# Altium schematic sheet 06_RS485.SchDoc: Схема электрическая принципиальная
size 420 x 297 mm; ApprovedBy: Скрябин; CheckedBy: Скрябин; Author: Корсунов; CompanyName: РТУ МИРЭА; SheetNumber: 6; SheetTotal: 11; PageSetup: Record=PageOptions|CenterHorizontal=True|CenterVertical=True|PrintScale=0.94|XCorrection=1.00|YCorrection=1.00|PrintKind=1|BorderSize=5000000|LeftOffset=0|BottomOffset=0|Orientation=1|PaperLength=1000|PaperWidth=1000|Scale=100|PaperSource=7|PrintQuality=-4|MediaType=1|DitherType=10|PaperKind=A4|PrintScaleMode=1; DecimalNumber: RP23.000001.006 Э3; Name1: Модуль ввода-вывода; lit_A: О; Name2: RP2350 OPC UA
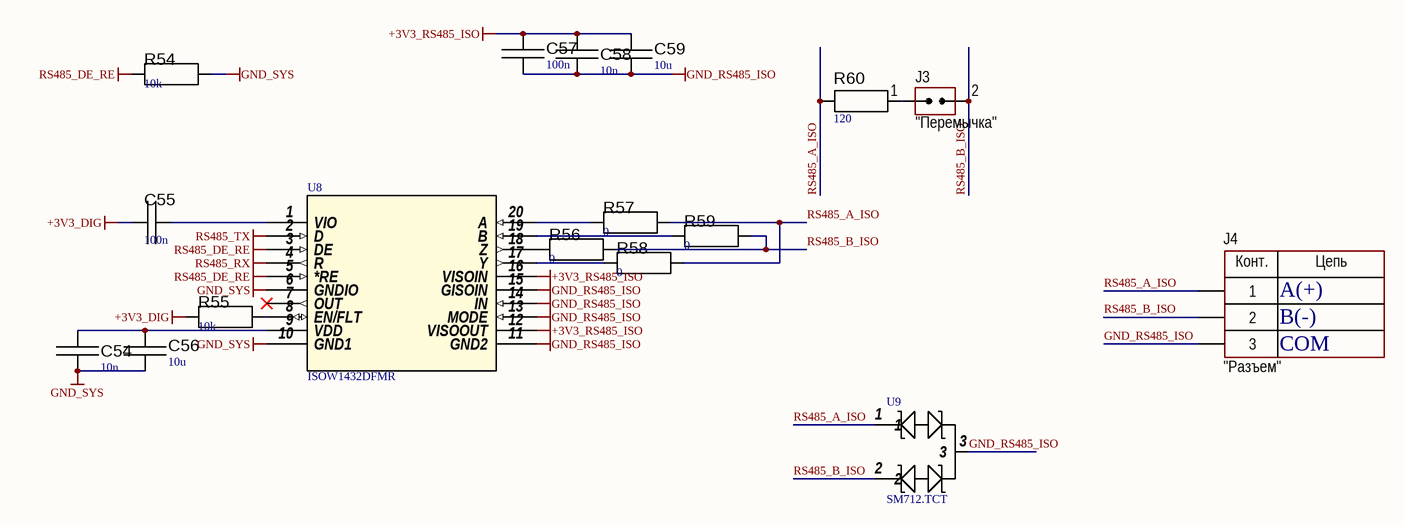
[diagram p0: 06_RS485.SchDoc]

## Parts
C54  value 10n  [C_0603]  (hidden comment: Capacitor)
C55  value 100n  [C_0603]  (hidden comment: Capacitor)
C56  value 10u  [C_0805]  (hidden comment: Capacitor)
C57  value 100n  [C_0603]  (hidden comment: Capacitor)
C58  value 10n  [C_0603]  (hidden comment: Capacitor)
C59  value 10u  [C_0805]  (hidden comment: Capacitor)
J3  CommentText: "Перемычка"  [CON: JUMPER x1]
J4  CommentText: "Разъем"  [CON: DG350-3.5-03P]
R54  value 10k  [R_0603]  (hidden comment: Resistor)
R55  value 10k  [R_0603]  (hidden comment: Resistor)
R56  value 0  [R_0603]  (hidden comment: Resistor)
R57  value 0  [R_0603]  (hidden comment: Resistor)
R58  value 0  [R_0603]  (hidden comment: Resistor)
R59  value 0  [R_0603]  (hidden comment: Resistor)
R60  value 120  [R_0603]  (hidden comment: Resistor)
U8  ISOW1432DFMR  [SOIC_2DFM_TEX]
U9  SM712.TCT  [SOT23_SEM]

## Nets
+3V3_DIG: C55.1 R55.1
+3V3_RS485_ISO: C57.1 C58.2 C59.2 U8.12(VISOOUT) U8.16(VISOIN)
GND_RS485_ISO: C57.2 C58.1 C59.1 J4.3 U8.11(GND2) U8.13(MODE) U8.14(IN) U8.15(GISOIN) U9.3
GND_SYS: C54.1 C56.1 R54.2 U8.6(GNDIO) U8.10(GND1)
RS485_DE_RE: R54.1 U8.3(DE) U8.5(*RE)
RS485_RX: U8.4(R)
RS485_TX: U8.2(D)
RS485_A_ISO: J4.1 R57.2 R58.2 R60.2 U9.1
RS485_B_ISO: J3.2(IN) J4.2 R56.2 R59.2 U9.2
NetC54_2: C54.2 C56.2 U8.9(VDD)
NetC55_2: C55.2 U8.1(VIO)
NetJ3_1: J3.1(IN) R60.1
NetR55_2: R55.2 U8.8(EN/FLT)
NetR56_1: R56.1 U8.18(Z)
NetR57_1: R57.1 U8.20(A)
NetR58_1: R58.1 U8.17(Y)
NetR59_1: R59.1 U8.19(B)

Not connected (* = marked no-connect by the designer): U8 7(OUT)*

## Notes on the sheet
- A(+)
- B(-)
- COM
- Перв.примен.
- Справ.№
- Подп. и дата
- Инв.№ дубл.
- Взам.инв.№
- Подп.и дата
- Разраб.
- Изм.
- Лист
- № докум.
- Подп.
- Дата
- Лит.
- Масштаб
- Масса
- Т.контр.
- Пров.
- СХЕМА   ЭЛЕКТРИЧЕСКАЯ
- ПРИНЦИПИАЛЬНАЯ
- Листов
- Инв.№ подл.
- Утв.
- Н.контр.
- Нач.сект.
- Формат  A3
- (in symbol Connector_terminal_3pin) Конт.; Цепь

## Library data of the parts
C54-C59 = Capacitor: SimulationGenericComponent: True
J3 = Jumper_single
J4 = Connector_terminal_3pin: Manufacturer: Degson; ValueManufacturerPartNumber: Terminal connector, 3pin, 3.5mm, 300VAC, 10A; PartNumber: DG350-3.5-03P-14; TypeConnector: Terminal connector; VoltageMax: 300VAC; Pitch: 3.5mm; CurrentMax: 10A; Multichannel: 3pin; HelpURL: https://www.chipdip.ru/product/dg350-3.5-03p-12
R54 R55 R60 = Resistor: TC1: 0; SimulationGenericComponent: True; TC2: 0
R56-R59 = Resistor: SimulationGenericComponent: True; TC1: 0; TC2: 0
U8 = ISOW1432DFMR: Low emissions, 5-kVrms, 12-Mbps isolated RS-485 transceiver with integrated DC/DC converter 20-SOIC -40 to 125; Manufacturer_Name: Texas Instruments; Type: Digital Isolators; Copyright: Copyright (C) 2026 Ultra Librarian. All rights reserved.; Manufacturer_Part_Number: ISOW1432DFMR; RefDes: RefDes
U9 = SM712.TCT: Description; Manufacturer_Name: Semtech; Copyright: Copyright (C) 2025 Ultra Librarian. All rights reserved.; Manufacturer_Part_Number: SM712.TCT